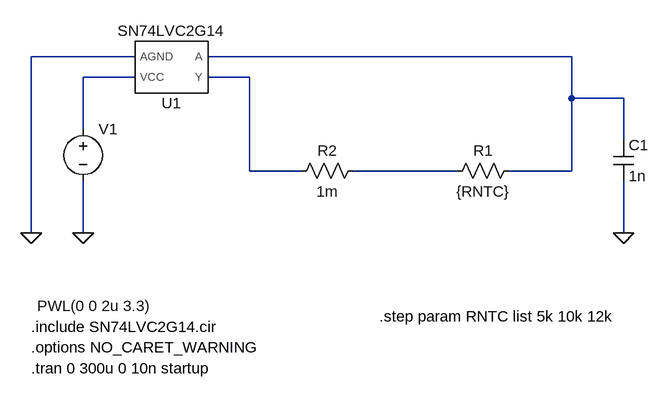
[diagram p0: schematic Temprature-Schmitt-Sensor.asc]
Temprature-Schmitt-Sensor.asc, the LTspice schematic file:
Version 4.1
SHEET 1 1000 828
WIRE 208 256 48 256
WIRE 880 256 320 256
WIRE 208 288 128 288
WIRE 384 288 320 288
WIRE 880 320 880 256
WIRE 960 320 880 320
WIRE 128 368 128 288
WIRE 960 384 960 320
WIRE 384 432 384 288
WIRE 464 432 384 432
WIRE 704 432 544 432
WIRE 880 432 880 320
WIRE 880 432 784 432
WIRE 48 528 48 256
WIRE 128 528 128 448
WIRE 960 528 960 448
FLAG 128 528 0
FLAG 48 528 0
FLAG 960 528 0
SYMBOL voltage 128 352 R0
WINDOW 3 -71 288 Left 2
WINDOW 123 0 0 Left 0
WINDOW 39 0 0 Left 0
SYMATTR InstName V1
SYMATTR Value PWL(0 0 2u 3.3)
SYMBOL res 800 416 R90
WINDOW 0 0 56 VBottom 2
WINDOW 3 32 56 VTop 2
SYMATTR InstName R1
SYMATTR Value {RNTC}
SYMBOL res 560 416 R90
WINDOW 0 0 56 VBottom 2
WINDOW 3 32 56 VTop 2
SYMATTR InstName R2
SYMATTR Value 1m
SYMBOL cap 944 384 R0
SYMATTR InstName C1
SYMATTR Value 1n
SYMBOL SN74LVC2G14 272 272 R180
SYMATTR InstName U1
TEXT 48 672 Left 2 !.include SN74LVC2G14.cir
TEXT 48 704 Left 2 !.options NO_CARET_WARNING
TEXT 48 736 Left 2 !.tran 0 300u 0 10n startup
TEXT 584 656 Left 2 !.step param RNTC list 5k 10k 12k

The netlist it stands for:
* Temprature-Schmitt-Sensor.asc
V1 N002 0 PWL(0 0 2u 3.3)
R1 N001 N004 {RNTC}
R2 N004 N003 1m
C1 N001 0 1n
X§U1 N003 N001 N002 0 SN74LVC2G14  ; pins Y A VCC AGND
.include SN74LVC2G14.cir
.options NO_CARET_WARNING
.tran 0 300u 0 10n startup
.step param RNTC list 5k 10k 12k
.lib SN74LVC2G14.cir
.backanno
.end